# Altium schematic sheet LCD_Conn.SchDoc
size A4
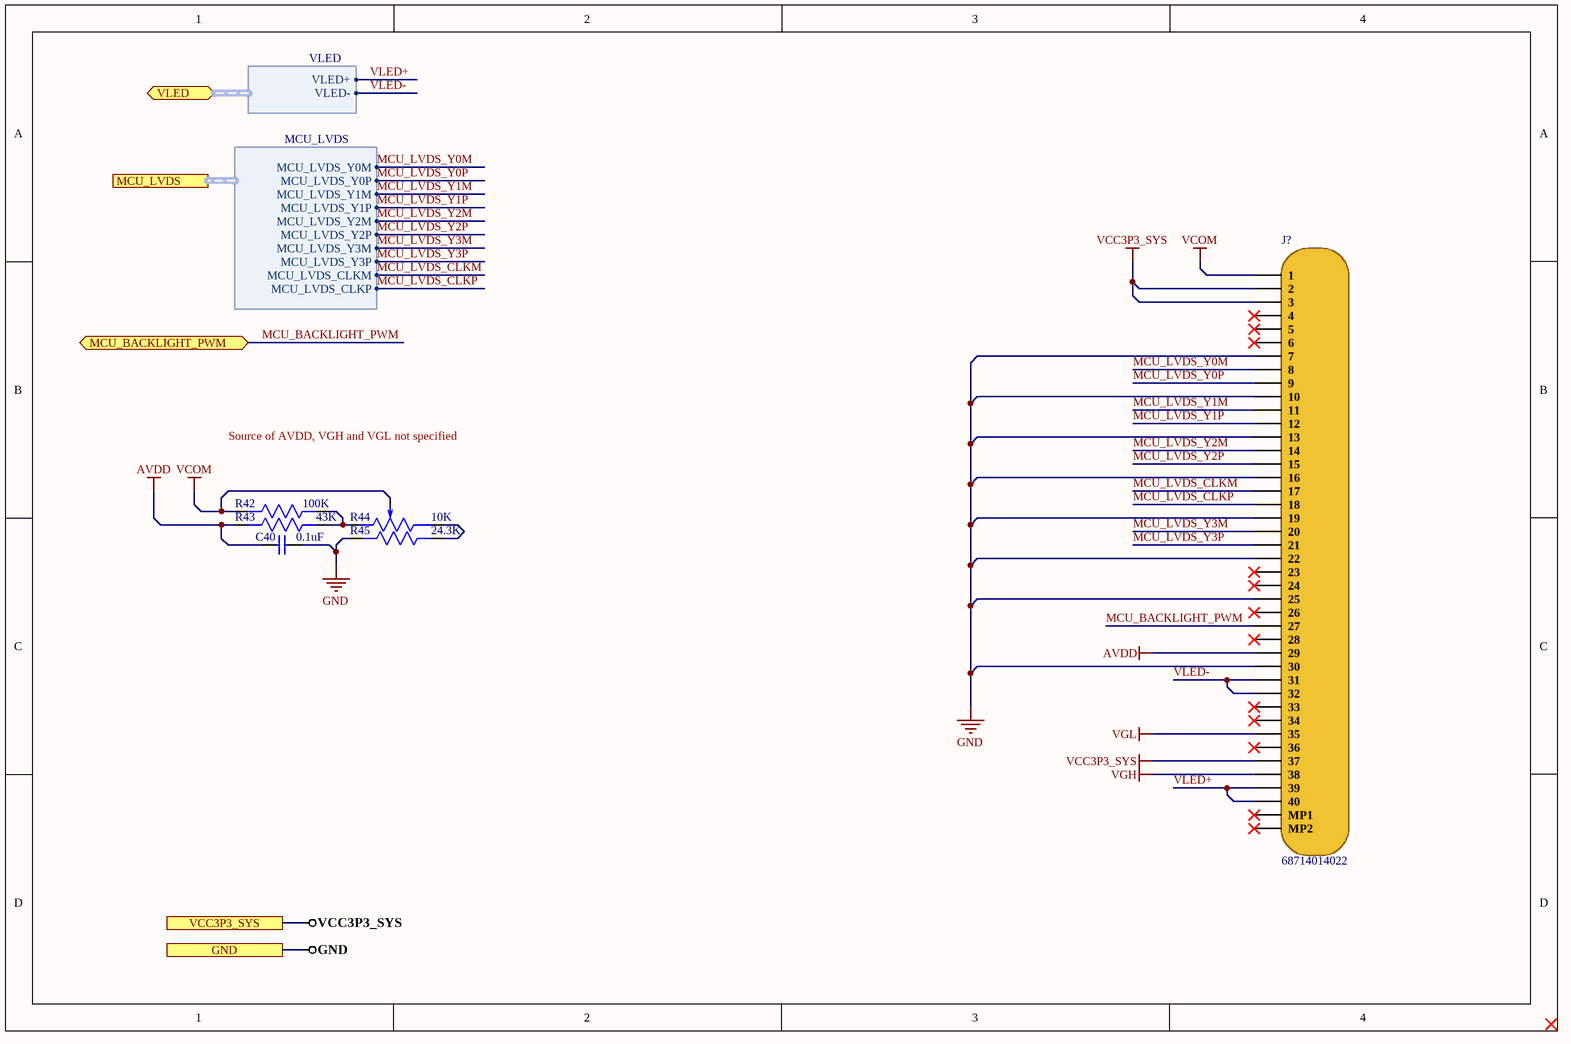
[diagram p0: LCD_Conn.SchDoc]

## Parts
C40  0.1uF  [CAP 0201]
J?  68714014022  [68714014022]
R42  100K  [Res-0201]
R43  43K  [Res-0201]
R44  10K  [TC33X-2-103E]
R45  24.3K  [Res-0201]

## Ports
GND, MCU_BACKLIGHT_PWM (bidir), MCU_LVDS (harness MCU_LVDS), VCC3P3_SYS, VLED (bidir, harness VLED)

## Harnesses
MCU_LVDS: MCU_LVDS_Y0M, MCU_LVDS_Y0P, MCU_LVDS_Y1M, MCU_LVDS_Y1P, MCU_LVDS_Y2M, MCU_LVDS_Y2P, MCU_LVDS_Y3M, MCU_LVDS_Y3P, MCU_LVDS_CLKM, MCU_LVDS_CLKP
VLED: VLED+, VLED-

## Nets
AVDD: C40.1 J?.29 R43.2
GND: C40.2 J?.7 J?.10 J?.13 J?.16 J?.19 J?.22 J?.25 J?.30 R45.2 ; port GND
VCC3P3_SYS: J?.2 J?.3 J?.37 ; port VCC3P3_SYS
VCOM: J?.1 R42.2 R44.2(wiper)
VGH: J?.38
VGL: J?.35
MCU_BACKLIGHT_PWM: J?.27 ; port MCU_BACKLIGHT_PWM
MCU_LVDS_CLKM: J?.17 ; port MCU_LVDS.MCU_LVDS_CLKM
MCU_LVDS_CLKP: J?.18 ; port MCU_LVDS.MCU_LVDS_CLKP
MCU_LVDS_Y0M: J?.8 ; port MCU_LVDS.MCU_LVDS_Y0M
MCU_LVDS_Y0P: J?.9 ; port MCU_LVDS.MCU_LVDS_Y0P
MCU_LVDS_Y1M: J?.11 ; port MCU_LVDS.MCU_LVDS_Y1M
MCU_LVDS_Y1P: J?.12 ; port MCU_LVDS.MCU_LVDS_Y1P
MCU_LVDS_Y2M: J?.14 ; port MCU_LVDS.MCU_LVDS_Y2M
MCU_LVDS_Y2P: J?.15 ; port MCU_LVDS.MCU_LVDS_Y2P
MCU_LVDS_Y3M: J?.20 ; port MCU_LVDS.MCU_LVDS_Y3M
MCU_LVDS_Y3P: J?.21 ; port MCU_LVDS.MCU_LVDS_Y3P
VLED+: J?.39 J?.40 ; port VLED.VLED+
VLED-: J?.31 J?.32 ; port VLED.VLED-
NetR42_1: R42.1 R43.1 R44.1(ccw)
NetR44_3: R44.3(cw) R45.1

Not connected (* = marked no-connect by the designer): J? 4* 5* 6* 23* 24* 26* 28* 33* 34* 36* MP1* MP2*

## Notes on the sheet
- Source of AVDD, VGH and VGL not specified

## Library data of the parts
C40 = GRM033C81E104KE14D: CAP CER 0.1UF 25V X6S 0201; Manufacturer: Murata; Capacitance: 100nF; Tolerance: 10%; Supplier 1: Digi-Key; Manufacturer Part Number: GRM033C81E104KE14D; RoHS: Yes; Category: Ceramic Capacitors; Stock 1: 91; Pricing 1: 1=0.10000, 10=0.05100, 50=0.02780, 100=0.02260, 500=0.01616, 1000=0.01270, 2500=0.01155, 5000=0.01063 (USD); Mount: Surface Mount; Case/Package: 0201; Case Code (Metric): 0603; Case Code (Imperial): 0201; Weight: 1.2E-05oz; Min Operating Temperature: -55°C; Max Operating Temperature: 105°C; Packaging: Tape and Reel; Voltage Rating: 25V; Dielectric: X6S; Termination: SMD/SMT; Voltage Rating (DC): 25V; Package Quantity: 15000; Length: 0.024inch; Width: 0.3mm; Height: 0.3mm; Thickness: 0.013inch; RoHS Compliant: Yes; ComponentLink1URL: http://www.mouser.com/ds/2/281/c02e-2905.pdf?src-supplier=Mouser; ComponentLink1Description: http://www.mouser.com/ds/2/281/c02e-2905.pdf?src-supplier=Mouser; ComponentLink2URL: http://www.farnell.com/datasheets/2722733.pdf?src-supplier=Farnell; ComponentLink2Description: http://www.farnell.com/datasheets/2722733.pdf?src-supplier=Farnell; ComponentLink3URL: http://search.murata.co.jp/Ceramy/image/img/A01X/G101/ENG/GRM033C81E104KE14-01.pdf?src-supplier=Digi-Key; ComponentLink3Description: http://search.murata.co.jp/Ceramy/image/img/A01X/G101/ENG/GRM033C81E104KE14-01.pdf?src-supplier=Digi-Key; Supplier Part Number 1: 490-10403-1-ND
J? = 68714014022: CONN FPC TOP 40POS 0.50MM R/A; Manufacturer: Wurth Electronics; Actuator Material: Polymer,Liquid Crystal Polymer; Current Rating: 500mA; Voltage Rating: 50V; Number of Positions: 40; Insulation Resistance: 100MR; Gender: Receptacle; Pitch: 0.5mm; Supplier 1: Digi-Key; Manufacturer Part Number: 68714014022; RoHS: Yes; Category: FFC / FPC; Stock 1: 5218; Pricing 1: 1=1.96000, 10=1.89700, 50=1.76600, 100=1.63500, 500=1.50500, 1000=1.37400 (USD); Mount: Surface Mount; Contact Plating: Tin; Contact Material: Bronze,Tin; Housing Material: Liquid Crystal Polymer; Min Operating Temperature: -25°C; Max Operating Temperature: 85°C; Number of Rows: 1; Package Quantity: 1; Packaging: Tape and Reel; Termination: Solder; Contact Location: Top; Number of Contacts: 40; Orientation: Straight; Length: 26.5mm; Width: 2.1mm; REACH SVHC: Unknown; Flammability Rating: UL94 V-0; ComponentLink1URL: https://datasheet.ciiva.com/8067/1707020-8067296.pdf?src-supplier=Element14; ComponentLink1Description: https://datasheet.ciiva.com/8067/1707020-8067296.pdf?src-supplier=Element14; ComponentLink2URL: https://datasheet.ciiva.com/25617/0900766b81113bff-25617752.pdf?src-supplier=RSComponents; ComponentLink2Description: https://datasheet.ciiva.com/25617/0900766b81113bff-25617752.pdf?src-supplier=RSComponents; ComponentLink3URL: https://datasheet.ciiva.com/670/6871xx14022-670666.pdf?src-supplier=Digi-Key; ComponentLink3Description: https://datasheet.ciiva.com/670/6871xx14022-670666.pdf?src-supplier=Digi-Key; ComponentLink4URL: https://datasheet.ciiva.com/670/6871xx14022-670667.pdf?src-supplier=Digi-Key; ComponentLink4Description: https://datasheet.ciiva.com/670/6871xx14022-670667.pdf?src-supplier=Digi-Key; ComponentLink5URL: https://datasheet.ciiva.com/670/6871xx14022-670668.pdf?src-supplier=Digi-Key; ComponentLink5Description: https://datasheet.ciiva.com/670/6871xx14022-670668.pdf?src-supplier=Digi-Key; ComponentLink6URL: https://datasheet.ciiva.com/14153/6871xx14022-eng-datasheet-14153919.pdf?src-supplier=Distrelec; ComponentLink6Description: https://datasheet.ciiva.com/14153/6871xx14022-eng-datasheet-14153919.pdf?src-supplier=Distrelec; Supplier Part Number 1: 732-3519-1-ND
R42 = RC0201JR-07100KL: RES SMD 100K OHM 5% 1/20W 0201
R43 = RC0201JR-0743KL: RES SMD 43K OHM 5% 1/20W 0201; Manufacturer: Yageo; Resistance: 43kR; Max Power Dissipation: 50mW; Temperature Coefficient: 200ppm/°C; Supplier 1: Digi-Key; Manufacturer Part Number: RC0201JR-0743KL; RoHS: Yes; Category: Chip SMD Resistors; Stock 1: 10000; Pricing 1: 1=0.10000, 10=0.02900, 100=0.01190, 1000=0.00536, 2500=0.00466, 5000=0.00385 (USD); Case/Package: 0201; Case Code (Metric): 0603; Case Code (Imperial): 0201; Min Operating Temperature: -55°C; Max Operating Temperature: 125°C; Packaging: Tape and Reel; Resistor Type: Thick Film; Number of Terminations: 2; Tolerance: 5%; Features: Moisture Resistant; Length: 0.024inch; Width: 0.012inch; Height: 0.01inch; RoHS Compliant: Yes; ComponentLink1URL: http://www.yageo.com.tw/exep/pages/download/literatures/PYu-R_INT-thick_7.pdf?src-supplier=Digi-Key; ComponentLink1Description: http://www.yageo.com.tw/exep/pages/download/literatures/PYu-R_INT-thick_7.pdf?src-supplier=Digi-Key; Supplier Part Number 1: YAG2901CT-ND
R44 = TC33X-2-103E: TRIMMER 10K OHM 0.1W J LEAD TOP; Manufacturer: Bourns; Tolerance: 25%; Resistance: 10kR; Number of Turns: 1; Power Rating: 100mW; Temperature Coefficient: 250ppm/°C; Voltage Rating (DC): 50V; Supplier 1: Digi-Key; Manufacturer Part Number: TC33X-2-103E; RoHS: Yes; Category: Variable Resistors and Potentiometers; Stock 1: 84845; Pricing 1: 1=0.26000, 10=0.25200, 25=0.22760, 50=0.21700, 100=0.21000, 250=0.19600, 500=0.17850, 1000=0.16100 (USD); Mount: Surface Mount; Color: Silver; Weight: 29.4mg; Contact Plating: Copper,Tin,Silver; Min Operating Temperature: -40°C; Max Operating Temperature: 100°C; Packaging: Tape and Reel; Package Quantity: 2500; Resistor Type: Cermet; Termination: Foot Print; Taper: Linear; Max Power Dissipation: 100mW; Series: TC33; Resistance Tolerance: 25%; Length: 3mm; Width: 0.118inch; Height: 0.047inch; Depth: 3.8mm; Radiation Hardening: No; REACH SVHC: No SVHC; Military Standard: Not; Lead Free: Lead Free; RoHS Compliant: Yes; ComponentLink1URL: https://datasheet.ciiva.com/11830/0900766b802749b3-11830705.pdf?src-supplier=RSComponents; ComponentLink1Description: https://datasheet.ciiva.com/11830/0900766b802749b3-11830705.pdf?src-supplier=RSComponents; ComponentLink2URL: https://datasheet.ciiva.com/7953/1818686-7953349.pdf?src-supplier=Element14; ComponentLink2Description: https://datasheet.ciiva.com/7953/1818686-7953349.pdf?src-supplier=Element14; ComponentLink3URL: https://datasheet.ciiva.com/26944/getdatasheetpartid-183773-26944166.pdf?src-supplier=Verical; ComponentLink3Description: https://datasheet.ciiva.com/26944/getdatasheetpartid-183773-26944166.pdf?src-supplier=Verical; ComponentLink4URL: https://datasheet.ciiva.com/2155/tc33-2155962.pdf?src-supplier=Digi-Key; ComponentLink4Description: https://datasheet.ciiva.com/2155/tc33-2155962.pdf?src-supplier=Digi-Key; ComponentLink5URL: https://datasheet.ciiva.com/2155/tc33-2155963.pdf?src-supplier=Digi-Key; ComponentLink5Description: https://datasheet.ciiva.com/2155/tc33-2155963.pdf?src-supplier=Digi-Key; ComponentLink6URL: https://datasheet.ciiva.com/2155/tc33-2155964.pdf?src-supplier=Digi-Key; ComponentLink6Description: https://datasheet.ciiva.com/2155/tc33-2155964.pdf?src-supplier=Digi-Key; ComponentLink7URL: https://datasheet.ciiva.com/8089/tc33-8089484.pdf?src-supplier=Avnet; ComponentLink7Description: https://datasheet.ciiva.com/8089/tc33-8089484.pdf?src-supplier=Avnet; ComponentLink8URL: https://datasheet.ciiva.com/28659/1520225-28659212.pdf?src-supplier=Element14; ComponentLink8Description: https://datasheet.ciiva.com/28659/1520225-28659212.pdf?src-supplier=Element14; ComponentLink9URL: https://datasheet.ciiva.com/16802/tc33-16802397.pdf?src-supplier=Avnet+Europe; ComponentLink9Description: https://datasheet.ciiva.com/16802/tc33-16802397.pdf?src-supplier=Avnet+Europe; Supplier Part Number 1: TC33X-103ECT-ND
R45 = RC0201FR-0724K3L: RES SMD 24.3K OHM 1% 1/20W 0201; Manufacturer: Yageo; Resistance: 24.3kR; Max Power Dissipation: 50mW; Temperature Coefficient: 200ppm/°C; Supplier 1: Digi-Key; Manufacturer Part Number: RC0201FR-0724K3L; RoHS: Yes; Category: Chip SMD Resistors; Stock 1: 97; Pricing 1: 1=0.10000, 10=0.04200, 100=0.01700, 1000=0.00765, 2500=0.00664, 5000=0.00548 (USD); Case/Package: 0201; Case Code (Metric): 0603; Case Code (Imperial): 0201; Min Operating Temperature: -55°C; Max Operating Temperature: 125°C; Tolerance: 1%; Packaging: Tape and Reel; Resistor Type: Thick Film; Number of Terminations: 2; Features: Moisture Resistant; Length: 0.024inch; Width: 0.012inch; Height: 0.01inch; RoHS Compliant: Yes; ComponentLink1URL: http://www.yageo.com/documents/recent/PYu-RC_Group_51_RoHS_L_9.pdf?src-supplier=Digi-Key; ComponentLink1Description: http://www.yageo.com/documents/recent/PYu-RC_Group_51_RoHS_L_9.pdf?src-supplier=Digi-Key; ComponentLink2URL: http://www.yageo.com.tw/exep/pages/download/literatures/PYu-R_INT-thick_7.pdf?src-supplier=Digi-Key; ComponentLink2Description: http://www.yageo.com.tw/exep/pages/download/literatures/PYu-R_INT-thick_7.pdf?src-supplier=Digi-Key; Supplier Part Number 1: YAG2532CT-ND